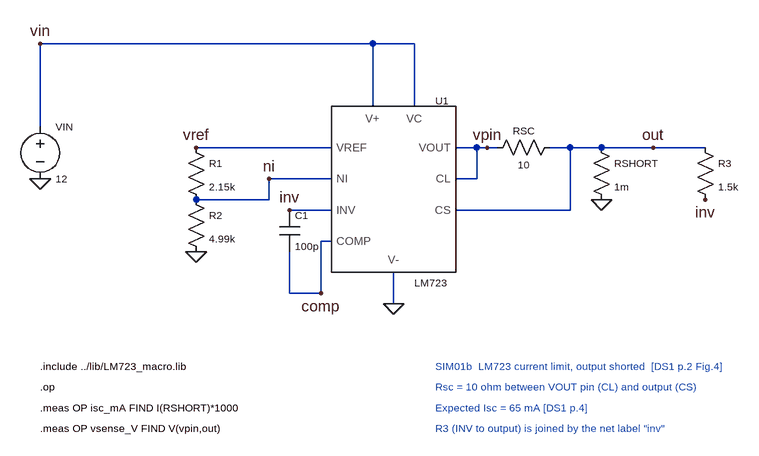
[diagram p0: schematic SIM01b_LM723_current_limit.asc]
SIM01b_LM723_current_limit.asc, the LTspice schematic file:
Version 4
SHEET 1 1400 900
WIRE 96 304 96 176
WIRE 96 176 672 176
WIRE 608 176 608 272
WIRE 672 176 672 272
WIRE 640 528 640 576
WIRE 544 336 336 336
WIRE 336 416 448 416
WIRE 448 416 448 384
WIRE 448 384 544 384
WIRE 544 432 480 432
WIRE 544 480 528 480
WIRE 528 480 528 560
WIRE 528 560 480 560
WIRE 480 560 480 496
FLAG 96 384 0
FLAG 640 576 0
FLAG 336 496 0
FLAG 96 176 vin
FLAG 336 336 vref
FLAG 448 384 ni
FLAG 480 432 inv
FLAG 528 560 comp
SYMBOL voltage 96 288 R0
WINDOW 0 24 16 Left 1
WINDOW 3 24 96 Left 1
SYMATTR InstName VIN
SYMATTR Value 12
SYMBOL LM723 640 400 R0
WINDOW 0 64 -136 Left 1
WINDOW 3 32 144 Left 1
SYMATTR InstName U1
SYMBOL res 320 320 R0
WINDOW 0 36 40 Left 1
WINDOW 3 36 76 Left 1
SYMATTR InstName R1
SYMATTR Value 2.15k
SYMBOL res 320 400 R0
WINDOW 0 36 40 Left 1
WINDOW 3 36 76 Left 1
SYMATTR InstName R2
SYMATTR Value 4.99k
SYMBOL cap 464 432 R0
WINDOW 0 24 8 Left 1
WINDOW 3 24 56 Left 1
SYMATTR InstName C1
SYMATTR Value 100p
WIRE 736 336 800 336
WIRE 736 384 768 384
WIRE 768 384 768 336
WIRE 880 336 960 336
WIRE 736 432 912 432
WIRE 912 432 912 336
WIRE 960 336 1120 336
FLAG 784 336 vpin
FLAG 1040 336 out
FLAG 960 416 0
FLAG 1120 416 inv
SYMBOL res 896 320 R90
WINDOW 0 0 56 VBottom 1
WINDOW 3 32 56 VTop 1
SYMATTR InstName RSC
SYMATTR Value 10
SYMBOL res 944 320 R0
WINDOW 0 36 40 Left 1
WINDOW 3 36 76 Left 1
SYMATTR InstName RSHORT
SYMATTR Value 1m
SYMBOL res 1104 320 R0
WINDOW 0 36 40 Left 1
WINDOW 3 36 76 Left 1
SYMATTR InstName R3
SYMATTR Value 1.5k
TEXT 96 672 Left 1 !.include ../lib/LM723_macro.lib
TEXT 96 704 Left 1 !.op
TEXT 96 736 Left 1 !.meas OP isc_mA FIND I(RSHORT)*1000
TEXT 96 768 Left 1 !.meas OP vsense_V FIND V(vpin,out)
TEXT 704 672 Left 1 ;SIM01b  LM723 current limit, output shorted  [DS1 p.2 Fig.4]
TEXT 704 704 Left 1 ;Rsc = 10 ohm between VOUT pin (CL) and output (CS)
TEXT 704 736 Left 1 ;Expected Isc = 65 mA [DS1 p.4]
TEXT 704 768 Left 1 ;R3 (INV to output) is joined by the net label "inv"

The netlist it stands for:
* SIM01b_LM723_current_limit.asc
VIN vin 0 12
XU1 vin 0 vin vpin vref ni inv comp vpin out LM723  ; pins V+ V- VC VOUT VREF NI INV COMP CL CS
R1 vref ni 2.15k
R2 ni 0 4.99k
C1 inv comp 100p
RSC out vpin 10
RSHORT out 0 1m
R3 out inv 1.5k
.include ../lib/LM723_macro.lib
.op
.meas OP isc_mA FIND I(RSHORT)*1000
.meas OP vsense_V FIND V(vpin,out)
* SIM01b  LM723 current limit, output shorted  [DS1 p.2 Fig.4]
* Rsc = 10 ohm between VOUT pin (CL) and output (CS)
* Expected Isc = 65 mA [DS1 p.4]
* R3 (INV to output) is joined by the net label "inv"
.backanno
.end